# Altium schematic sheet Safety_Control.SchDoc
size 431 x 279 mm; SheetNumber: 4; SheetTotal: 5
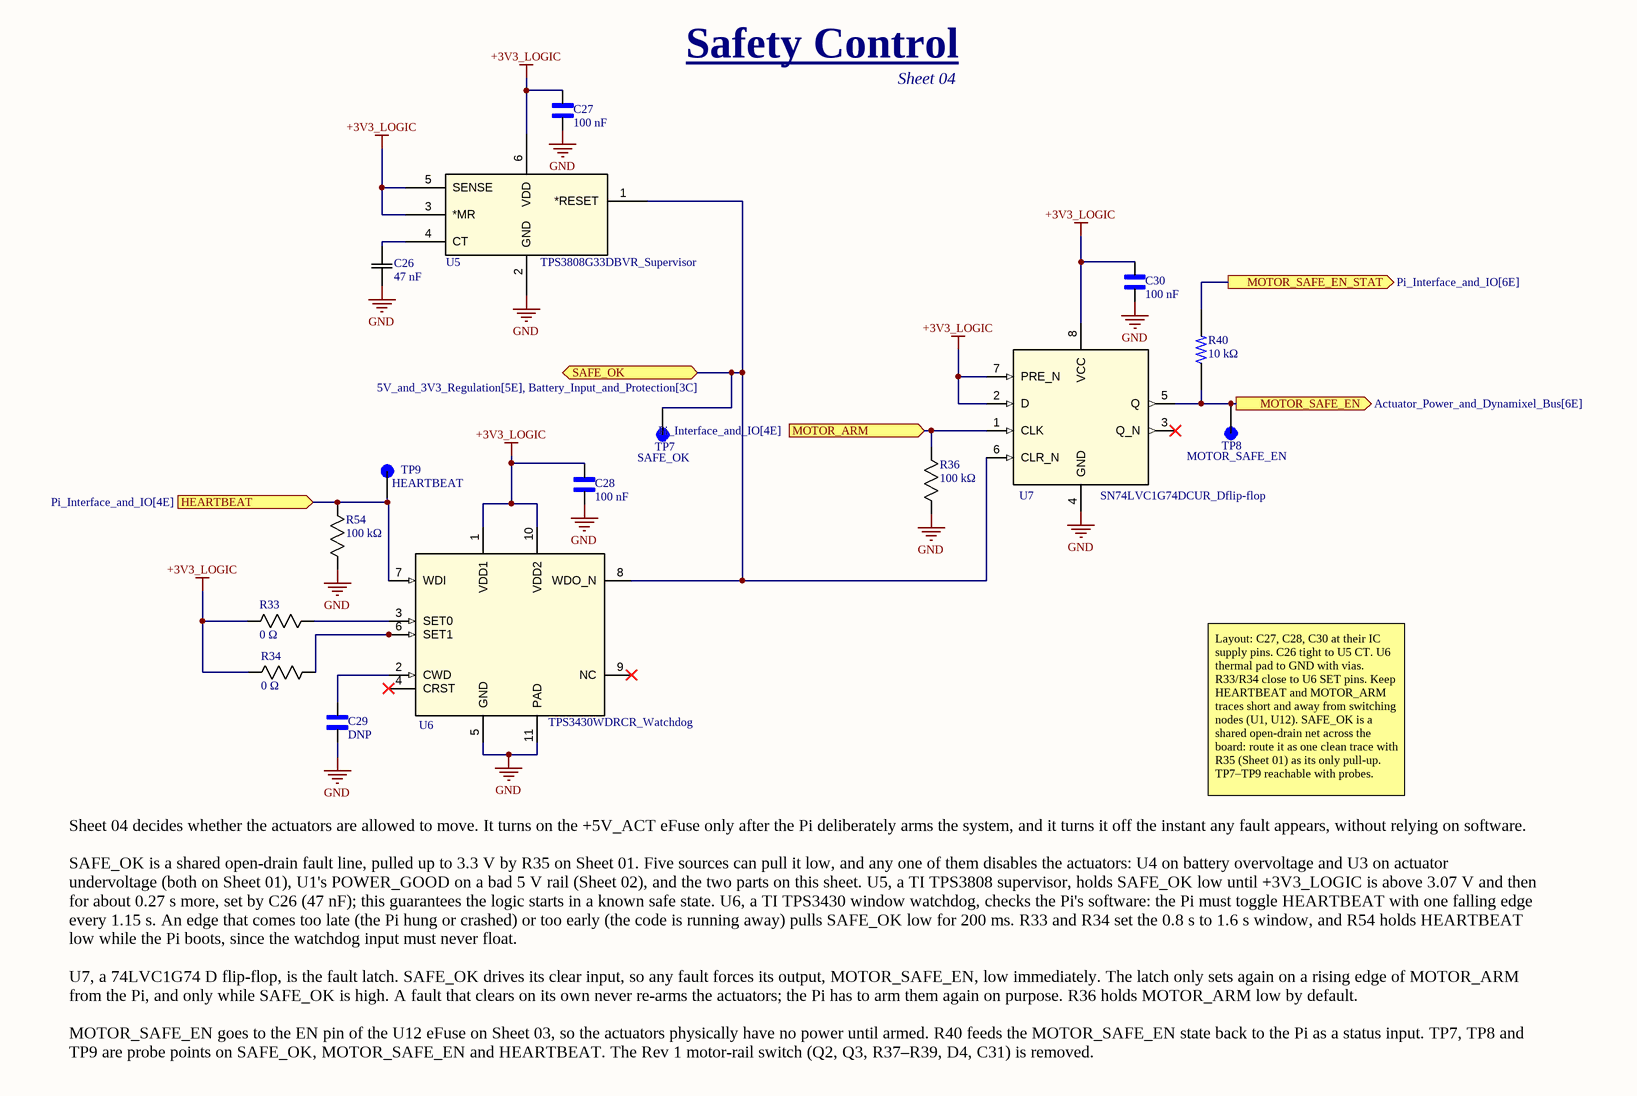
[diagram p0: Safety_Control.SchDoc]

## Parts
C26  47 nF  [YAG_CC0603_YAG]
C27  100 nF  [CAPC1608X90N]
C28  100 nF  [CAPC1608X90N]
C29  DNP  [CAPC1608X90N]
C30  100 nF  [CAPC1608X90N]
R33  0 Ω  [RC0603N_YAG]
R34  0 Ω  [RC0603N_YAG]
R36  100 kΩ  [RC0603N_YAG]
R40  10 kΩ  [RESC1607X60N]
R54  100 kΩ  [RC0603N_YAG]
TP7  SAFE_OK  [KEYSTONE_5015]
TP8  MOTOR_SAFE_EN  [KEYSTONE_5015]
TP9  HEARTBEAT  [KEYSTONE_5015]
U5  TPS3808G33DBVR_Supervisor  [DBV6]
U6  TPS3430WDRCR_Watchdog  [DRC0010J]
U7  SN74LVC1G74DCUR_Dflip-flop  [DCU0008A_N]

## Ports
HEARTBEAT (in, see Pi_Interface_and_IO[4E]), MOTOR_ARM (in, see Pi_Interface_and_IO[4E]), MOTOR_SAFE_EN (out, see Actuator_Power_and_Dynamixel_Bus[6E]), MOTOR_SAFE_EN_STAT (out, see Pi_Interface_and_IO[6E]), SAFE_OK (bidir, see 5V_and_3V3_Regulation[5E], Battery_Input_and_Protection[3C])

## Nets
+3V3_LOGIC: C27.2 C28.2 C30.2 R33.2 R34.2 U5.3(*MR) U5.5(SENSE) U5.6(VDD) U6.1(VDD1) U6.10(VDD2) U7.2(D) U7.7(PRE_N) U7.8(VCC)
GND: C26.1 C27.1 C28.1 C29.1 C30.1 R36.2 R54.1 U5.2(GND) U6.5(GND) U6.11(PAD) U7.4(GND)
HEARTBEAT: R54.2 TP9.TP U6.7(WDI) ; port HEARTBEAT
MOTOR_ARM: R36.1 U7.1(CLK) ; port MOTOR_ARM
MOTOR_SAFE_EN: R40.1 TP8.TP U7.5(Q) ; port MOTOR_SAFE_EN
MOTOR_SAFE_EN_STAT: R40.2 ; port MOTOR_SAFE_EN_STAT
SAFE_OK: TP7.TP U5.1(*RESET) U6.8(WDO_N) U7.6(CLR_N) ; port SAFE_OK
NetC26_2: C26.2 U5.4(CT)
NetC29_2: C29.2 U6.2(CWD)
NetR33_1: R33.1 U6.3(SET0)
NetR34_1: R34.1 U6.6(SET1)

Not connected (* = marked no-connect by the designer): U6 4(CRST)* 9(NC)*; U7 3(Q_N)*

## Notes on the sheet
- Safety Control
- Sheet 04
- Layout: C27, C28, C30 at their IC supply pins. C26 tight to U5 CT. U6 thermal pad to GND with vias. R33/R34 close to U6 SET pins. Keep HEARTBEAT and MOTOR_ARM traces short and away from switching nodes (U1, U12). SAFE_OK is a shared open-drain net across the board: route it as one clean trace with R35 (Sheet 01) as its only pull-up. TP7–TP9 reachable with probes.
- Sheet 04 decides whether the actuators are allowed to move. It turns on the +5V_ACT eFuse only after the Pi deliberately arms the system, and it turns it off the instant any fault appears, without relying on software.
  SAFE_OK is a shared open-drain fault line, pulled up to 3.3 V by R35 on Sheet 01. Five sources can pull it low, and any one of them disables the actuators: U4 on battery overvoltage and U3 on actuator undervoltage (both on Sheet 01), U1's POWER_GOOD on a bad 5 V rail (Sheet 02), and the two parts on this sheet. U5, a TI TPS3808 supervisor, holds SAFE_OK low until +3V3_LOGIC is above 3.07 V and then for about 0.27 s more, set by C26 (47 nF); this guarantees the logic starts in a known safe state. U6, a TI TPS3430 window watchdog, checks the Pi's software: the Pi must toggle HEARTBEAT with one falling edge every 1.15 s. An edge that comes too late (the Pi hung or crashed) or too early (the code is running away) pulls SAFE_OK low for 200 ms. R33 and R34 set the 0.8 s to 1.6 s window, and R54 holds HEARTBEAT low while the Pi boots, since the watchdog input must never float.
  U7, a 74LVC1G74 D flip-flop, is the fault latch. SAFE_OK drives its clear input, so any fault forces its output, MOTOR_SAFE_EN, low immediately. The latch only sets again on a rising edge of MOTOR_ARM from the Pi, and only while SAFE_OK is high. A fault that clears on its own never re-arms the actuators; the Pi has to arm them again on purpose. R36 holds MOTOR_ARM low by default.
  MOTOR_SAFE_EN goes to the EN pin of the U12 eFuse on Sheet 03, so the actuators physically have no power until armed. R40 feeds the MOTOR_SAFE_EN state back to the Pi as a status input. TP7, TP8 and TP9 are probe points on SAFE_OK, MOTOR_SAFE_EN and HEARTBEAT. The Rev 1 motor-rail switch (Q2, Q3, R37–R39, D4, C31) is removed.
- DWG. NO.
- REV.
- SHT.
- THIS DOCUMENT AND THE DATA DISCLOSED HEREIN OR HEREWITH IS THE PROPERTY OF ALTIUM LIMITED AND MAY BE FREELY DISTRIBUTED IN WHOLE. NO RIGHTS ARE RESERVED OR EXPRESS OR IMPLIED WARANTEE GIVEN.
- REVISION
- DESCRIPTION
- DATE
- APPROVED
- ENG:
- APPROVALS
- PROJECT
- DSN:
- CHK:
- REFERENCE DOCUMENTS
- PROJECT REVISION:
- TITLE
- DOCUMENT REVISION:
- DESIGN ITEM:
- BOM:
- FAB DWG:
- PCB DWG:
- ASSY DWG:
- SCALE:
- SIZE
- B
- CAGE CODE
- FILE NAME
- DWG NO.
- SHEET
- OF
- REV

## Library data of the parts
C26 = CC0603KRX7R9BB473: Yageo CC0603KRX7R9BB473 / 47 nF 50 V X7R / 0603 / U5 CT delay: 47 nF / 175 nF + 0.5 ms ≈ 0.27 s / https://www.digikey.com/en/products/result?keywords=CC0603KRX7R9BB473; Copyright: Copyright (C) 2026 Ultra Librarian. All rights reserved.; Manufacturer_Name: Yageo; Manufacturer_Part_Number: CC0603KRX7R9BB473
C27 = GRM188R71H104KA93D: SMD Capacitor X7R(EIA) with Capacitance: 0.10uF Tol. 10%. Rated Voltage: 50Vdc / Murata GRM188R71H104KA93D / 100 nF 50 V X7R / 0603 / U5 supply / https://www.digikey.com/en/products/result?keywords=GRM188R71H104KA93D; SnapEDA_Link: https://www.snapeda.com/parts/GRM188R71H104KA93D/Murata/view-part/?ref=snap; Package: 1608 Murata; Value: *; MF: Murata; MP: GRM188R71H104KA93D; Check_prices: https://www.snapeda.com/parts/GRM188R71H104KA93D/Murata/view-part/?ref=eda
C28 C29 = GRM188R71H104KA93D: SMD Capacitor X7R(EIA) with Capacitance: 0.10uF Tol. 10%. Rated Voltage: 50VdcMurata GRM188R71H104KA93D / 100 nF 50 V X7R / 0603 / U6 supply / https://www.digikey.com/en/products/result?keywords=GRM188R71H104KA93D; MF: Murata; SnapEDA_Link: https://www.snapeda.com/parts/GRM188R71H104KA93D/Murata/view-part/?ref=snap; Package: 1608 Murata; Value: *; MP: GRM188R71H104KA93D; Check_prices: https://www.snapeda.com/parts/GRM188R71H104KA93D/Murata/view-part/?ref=eda
C30 = GRM188R71H104KA93D: SMD Capacitor X7R(EIA) with Capacitance: 0.10uF Tol. 10%. Rated Voltage: 50Vdc / Murata GRM188R71H104KA93D / 100 nF 50 V X7R / 0603 / U7 supply / https://www.digikey.com/en/products/result?keywords=GRM188R71H104KA93D; SnapEDA_Link: https://www.snapeda.com/parts/GRM188R71H104KA93D/Murata/view-part/?ref=snap; Package: 1608 Murata; Value: *; MF: Murata; MP: GRM188R71H104KA93D; Check_prices: https://www.snapeda.com/parts/GRM188R71H104KA93D/Murata/view-part/?ref=eda
R33 R34 = RC0603JR-070RL: RES SMD 0 OHM 1% JUMPER 1/10W 0603 / 0 Ω / https://www.digikey.com/en/products/category/resistors/2?s=N4IgTCBcDaIEoGEAMA2JBmAUnAtEg7EnADIgC6AvkA; Manufacturer_Name: Yageo; Copyright: Copyright (C) 2025 Ultra Librarian. All rights reserved.; Manufacturer_Part_Number: RC0603JR-070RL
R36 = RC0603FR-07100KL: RES, 100 k, 1%, 0.1 W, 0603 / Yageo RC0603FR-07100KL / 100 kΩ 1 % / 0603 / MOTOR_ARM pulldown / https://www.digikey.com/en/products/result?keywords=RC0603FR-07100KL; Copyright: Copyright (C) 2025 Ultra Librarian. All rights reserved.; Manufacturer_Name: Yageo; Manufacturer_Part_Number: RC0603FR-07100KL
R40 = RC0603FR-0710KL: 10 kOhms Â±1% 0.1W, 1/10W Chip Resistor 0603 (1608 Metric) Moisture Resistant Thick Film / Yageo RC0603FR-0710KL / 10 kΩ 1 % / 0603 / Series to Pi on MOTOR_SAFE_EN status / https://www.digikey.com/en/products/result?keywords=RC0603FR-0710KL; SnapEDA_Link: https://www.snapeda.com/parts/RC0603FR-0710KL/Yageo/view-part/?ref=snap; Package: 0603 Yageo; Value: *; MF: Yageo; MP: RC0603FR-0710KL; Check_prices: https://www.snapeda.com/parts/RC0603FR-0710KL/Yageo/view-part/?ref=eda
R54 = RC0603FR-07100KL: RES, 100 k, 1%, 0.1 W, 0603 / Yageo RC0603FR-07100KL / 100 kΩ 1 % / 0603 / HEARTBEAT pulldown: TI says WDI must never float, and the Pi pin is Hi-Z while it boots / https://www.digikey.com/en/products/result?keywords=RC0603FR-07100KL; Copyright: Copyright (C) 2025 Ultra Librarian. All rights reserved.; Manufacturer_Name: Yageo; Manufacturer_Part_Number: RC0603FR-07100KL
TP7-TP9 = 5015: Test Point Micro Mini SMT Phos Bronze/Silver 1000pc Tape & Reel | Keystone Electronics 5015; SnapEDA_Link: https://www.snapeda.com/parts/5015/Keystone/view-part/?ref=snap; Package: None; Value: *; MF: Keystone Electronics; MP: 5015; Check_prices: https://www.snapeda.com/parts/5015/Keystone/view-part/?ref=eda
U5 = TPS3808G33DBVR: Low-quiescent current supervisor with programmable delay & manual reset 6-SOT-23 -40 to 125; Manufacturer_Name: Texas Instruments; Copyright: Copyright (C) 2025 Ultra Librarian. All rights reserved.; Manufacturer_Part_Number: TPS3808G33DBVR; RefDes: RefDes; Type: Type
U6 = TPS3430WDRCR: Window watchdog timer with programmable reset delay 10-VSON -40 to 125; Manufacturer_Name: Texas Instruments; TYPE: TYPE; RefDes: RefDes; Copyright: Copyright (C) 2026 Ultra Librarian. All rights reserved.; Manufacturer_Part_Number: TPS3430WDRCR
U7 = SN74LVC1G74DCUR: Single Positive-Edge-Triggered D-Type Flip-Flop With Clear and Preset 8-VSSOP -40 to 125; Manufacturer_Name: Texas Instruments; Alternate_PartNumber: SN74LVC1G74DCUT; CompType: IC; TYPE: TYPE; RefDes: RefDes; Copyright: Copyright (C) 2026 Ultra Librarian. All rights reserved.; Manufacturer_Part_Number: SN74LVC1G74DCUR; Application_BuildNumber: *; PartNumber: SN74LVC1G74DCUR; PackageReference: DCU0008A; MountType: SMT; RoHS: Y; Manufacturer: Texas Instruments